# Altium schematic sheet 1_主体.schdoc
size 429 x 307 mm; Symbol: Drawing-Symbol_A4; Device: Drawing-Symbol_A4; Company: 嘉立创EDA; Version: V1.0; Page Size: A4; @Project Name: stm32f4; @Page Count: 3; @Update Date: 2025-11-05; @Create Date: 2025-11-05; @Schematic Name: Schematic1; @Page No: 1; @Page Name: 主体; @Create Time: 08:26:21; @Update Time: 16:26:23; Width: 1655; Height: 1170; Region Start: 1; X Region Count: 6; Y Region Count: 4; Blade Width: 10; Title Block Position: 3; @Board Name: Board1
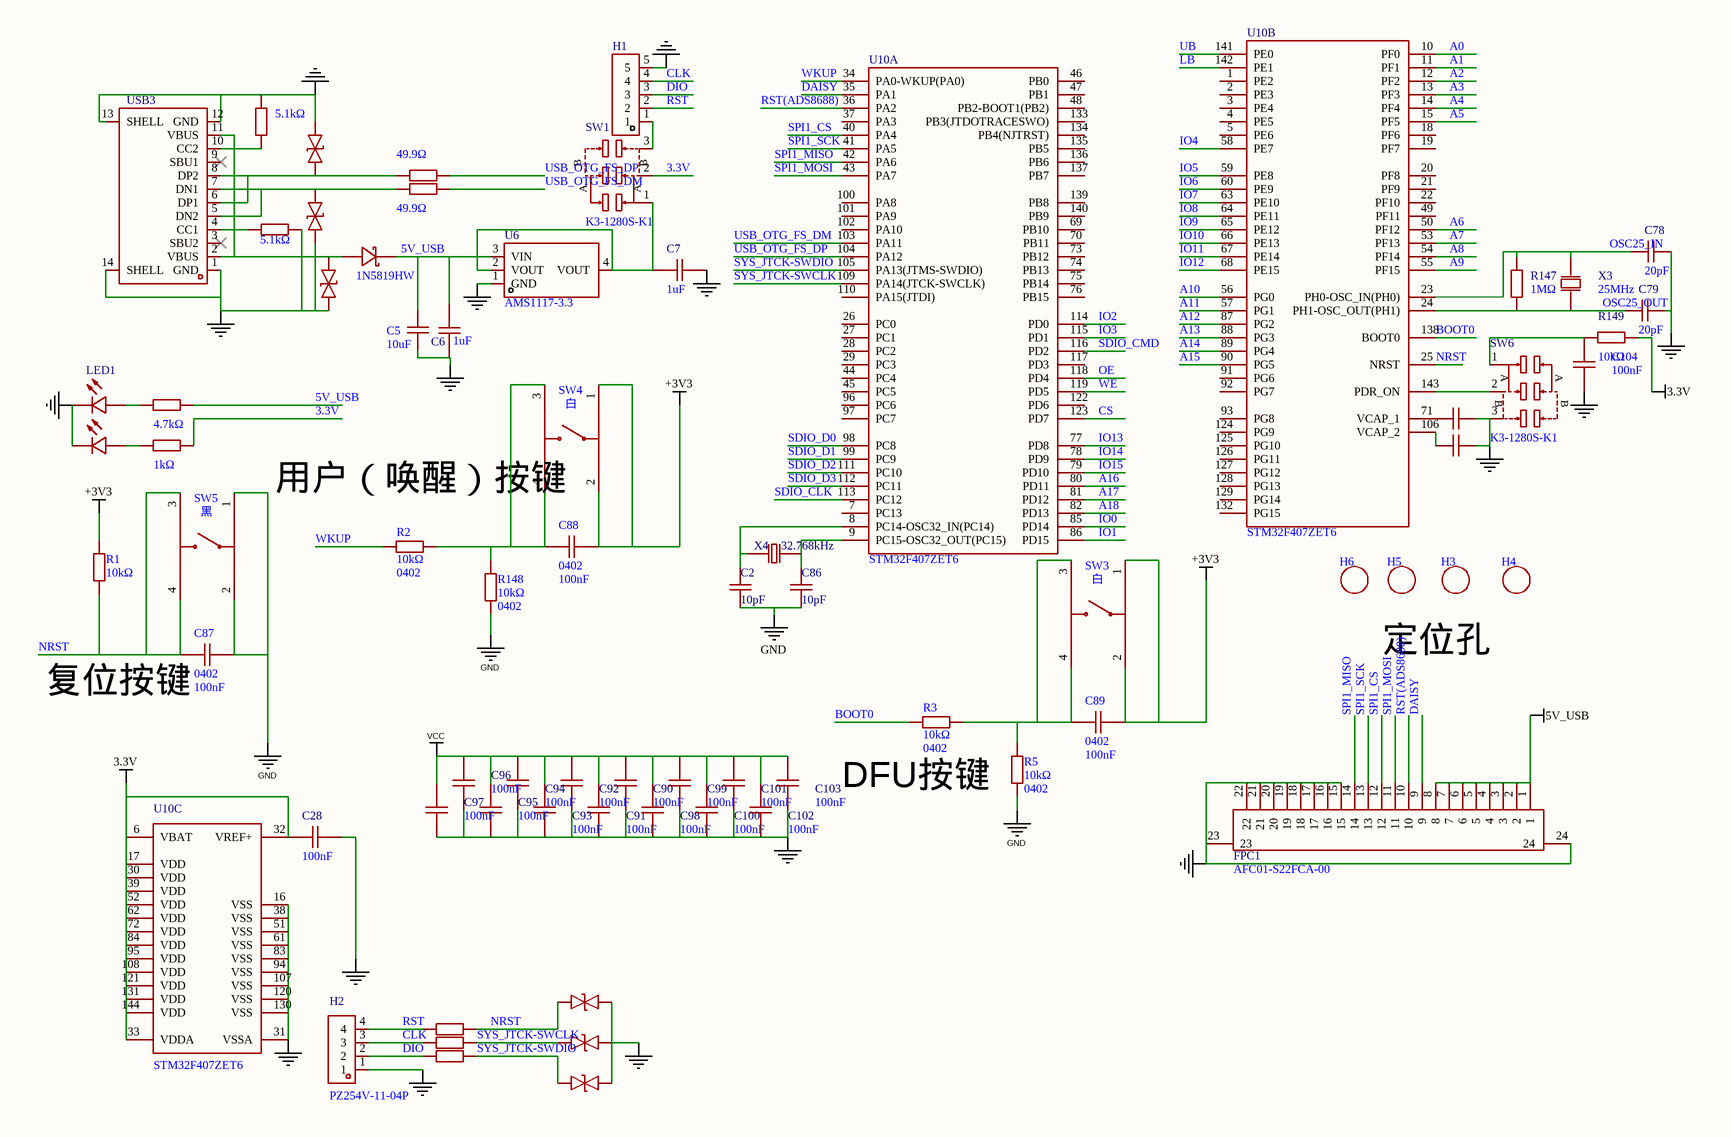
[diagram p0: 1_主体.schdoc]

## Parts
C2  value 10pF  [r0402]
C5  10uF  [C0603]
C6  1uF  [C0603]
C7  1uF  [C0603]
C28  100nF  [C0603]
C78  20pF  [C0603]
C79  20pF  [C0603]
C80  2.2uF  [C0603]  (value not drawn)
C81  2.2uF  [C0603]  (value not drawn)
C86  value 10pF  [r0402]
C87  Supplier Footprint: 0402  [C0402]  (hidden comment: 100nF)
C88  Supplier Footprint: 0402  [C0402]  (hidden comment: 100nF)
C89  Supplier Footprint: 0402  [C0402]  (hidden comment: 100nF)
C90  100nF  [C0402]
C91  100nF  [C0402]
C92  100nF  [C0402]
C93  100nF  [C0402]
C94  100nF  [C0402]
C95  100nF  [C0402]
C96  100nF  [C0402]
C97  100nF  [C0402]
C98  100nF  [C0402]
C99  100nF  [C0402]
C100  100nF  [C0402]
C101  100nF  [C0402]
C102  100nF  [C0402]
C103  100nF  [C0402]
C104  100nF  [C0402]
D9  0603ESDA-05N  [D0603-BI]  (value not drawn)
D10  0603ESDA-05N  [D0603-BI]  (value not drawn)
D11  0603ESDA-05N  [D0603-BI]  (value not drawn)
D13  LESD5D5.0CT1G  [SOD-523_L1.2-W0.8-LS1.6-BI]  (value not drawn)
D14  LESD5D5.0CT1G  [SOD-523_L1.2-W0.8-LS1.6-BI]  (value not drawn)
D15  LESD5D5.0CT1G  [SOD-523_L1.2-W0.8-LS1.6-BI]  (value not drawn)
D16  1N5819HW  [SOD-123_L2.7-W1.6-LS3.7-RD-1]
FPC1  AFC01-S22FCA-00  [FPC-SMD_P0.5-22P_FGS-XJ-H2.0]
H1  PZ254V-11-05P  [HDR-TH_5P-P2.54-V-M]  (value not drawn)
H2  PZ254V-11-04P  [HDR-TH_4P-P2.54-V-M]
H3  M3  [m3 125x300]  (value not drawn)
H4  M3  [m3 125x300]  (value not drawn)
H5  M3  [m3 125x300]  (value not drawn)
H6  M3  [m3 125x300]  (value not drawn)
LED1  19-217/R6C-AL1M2VY/3T  [LED0603-RD]  (value not drawn)
LED5  19-213/Y2C-CQ2R2L/3T(CY)  [LED0603-RD-YELLOW]  (value not drawn)
R1  10kΩ  [R0402]
R2  Supplier Footprint: 0402  [R0402]  (hidden comment: 10kΩ)
R3  Supplier Footprint: 0402  [R0402]  (hidden comment: 10kΩ)
R5  Supplier Footprint: 0402  [R0402]  (hidden comment: 10kΩ)
R7  49.9Ω  [R0603]  (value not drawn)
R8  49.9Ω  [R0603]  (value not drawn)
R9  49.9Ω  [R0603]  (value not drawn)
R21  49.9Ω  [R0603]
R22  49.9Ω  [R0603]
R24  5.1kΩ  [R0402]
R25  5.1kΩ  [R0402]
R26  4.7kΩ  [R0402]
R27  1kΩ  [R0402]
R147  1MΩ  [R0603]
R148  Supplier Footprint: 0402  [R0402]  (hidden comment: 10kΩ)
R149  10kΩ  [R0402]
SW1  K3-1280S-K1  [SW-SMD_K3-1280S-K1]
SW3  键帽颜色: 白  [SW-SMD_4P-L4.2-W3.4-P2.15-LS5.2]  (hidden comment: TSA017A2540A07)
SW4  键帽颜色: 白  [SW-SMD_4P-L4.2-W3.4-P2.15-LS5.2]  (hidden comment: TSA017A2540A07)
SW5  键帽颜色: 黑  [SW-SMD_4P-L4.2-W3.4-P2.15-LS5.2]  (hidden comment: TSA017A2540A03)
SW6  K3-1280S-K1  [SW-SMD_K3-1280S-K1]
U6  AMS1117-3.3  [SOT-223-3_L6.5-W3.4-P2.30-LS7.0-BR]
U10  STM32F407ZET6  [LQFP-144_L20.0-W20.0-P0.50-LS22.0-BL]  (parts A,B,C of 3)
USB3  TYPE-C 16PIN 2MD(073)  [USB-C-SMD_TYPE-C-6PIN-2MD-073]  (value not drawn)
X3  25MHz  [OSC-SMD_L5.0-W3.2]
X4  value 32.768kHz  [crystal-smd_l3.2-w1.5-1]

## Nets
3.3V: C28.1 R27.2 R149.2 SW1.2 U10.6(VBAT) U10.17(VDD) U10.30(VDD) U10.32(VREF+) U10.33(VDDA) U10.39(VDD) U10.52(VDD) U10.62(VDD) U10.72(VDD) U10.84(VDD) U10.95(VDD) U10.108(VDD) U10.121(VDD) U10.131(VDD) U10.144(VDD)
5V_USB: C5.2 C6.2 D16.1(K) FPC1.1 FPC1.2 FPC1.3 FPC1.4 FPC1.5 FPC1.6 FPC1.7 FPC1.8 R26.2 U6.3(VIN)
+3V3: C88.1 C89.1 R1.1 SW3.1 SW3.2 SW4.1 SW4.2
GND: C2.1 C5.1 C6.1 C7.2 C28.2 C78.1 C79.1 C80.2 C81.2 C86.1 C87.1 C90.2 C91.2 C92.2 C93.2 C94.2 C95.2 C96.2 C97.2 C98.2 C99.2 C100.2 C101.2 C102.2 C103.2 C104.1 D9.2 D10.2 D11.2 D13.1 D14.1 D15.1 FPC1.15 FPC1.16 FPC1.17 FPC1.18 FPC1.19 FPC1.20 FPC1.21 FPC1.22 FPC1.23 FPC1.24 H1.5 H2.1 LED1.1(C) LED5.1(C) R5.2 R24.2 R25.2 R148.2 SW5.1 SW5.2 SW6.3 U6.1(GND) U10.16(VSS) U10.31(VSSA) U10.38(VSS) U10.51(VSS) U10.61(VSS) U10.83(VSS) U10.94(VSS) U10.107(VSS) U10.120(VSS) U10.130(VSS) USB3.1(GND) USB3.12(GND) USB3.13(SHELL) USB3.14(SHELL)
VCC: C90.1 C91.1 C92.1 C93.1 C94.1 C95.1 C96.1 C97.1 C98.1 C99.1 C100.1 C101.1 C102.1 C103.1
A0: U10.10(PF0)
A1: U10.11(PF1)
A2: U10.12(PF2)
A3: U10.13(PF3)
A4: U10.14(PF4)
A5: U10.15(PF5)
A6: U10.50(PF12)
A7: U10.53(PF13)
A8: U10.54(PF14)
A9: U10.55(PF15)
A10: U10.56(PG0)
A11: U10.57(PG1)
A12: U10.87(PG2)
A13: U10.88(PG3)
A14: U10.89(PG4)
A15: U10.90(PG5)
A16: U10.80(PD11)
A17: U10.81(PD12)
A18: U10.82(PD13)
BOOT0: R3.1 U10.138(BOOT0)
CLK: H1.4 H2.3 R8.1
CS: U10.123(PD7)
DAISY: FPC1.9 U10.35(PA1)
DIO: H1.3 H2.2 R9.1
IO0: U10.85(PD14)
IO1: U10.86(PD15)
IO2: U10.114(PD0)
IO3: U10.115(PD1)
IO4: U10.58(PE7)
IO5: U10.59(PE8)
IO6: U10.60(PE9)
IO7: U10.63(PE10)
IO8: U10.64(PE11)
IO9: U10.65(PE12)
IO10: U10.66(PE13)
IO11: U10.67(PE14)
IO12: U10.68(PE15)
IO13: U10.77(PD8)
IO14: U10.78(PD9)
IO15: U10.79(PD10)
LB: U10.142(PE1)
NRST: C87.2 D9.1 R1.2 R7.2 SW5.3 SW5.4 U10.25(NRST)
OE: U10.118(PD4)
OSC25_IN: C78.2 R147.2 U10.23(PH0-OSC_IN(PH0)) X3.2(OSC2)
OSC25_OUT: C79.2 R147.1 U10.24(PH1-OSC_OUT(PH1)) X3.1(OSC1)
RST: H1.2 H2.4 R7.1
RST(ADS8688): FPC1.10 U10.36(PA2)
SDIO_CLK: U10.113(PC12)
SDIO_CMD: U10.116(PD2)
SDIO_D0: U10.98(PC8)
SDIO_D1: U10.99(PC9)
SDIO_D2: U10.111(PC10)
SDIO_D3: U10.112(PC11)
SPI1_CS: FPC1.12 U10.40(PA4)
SPI1_MISO: FPC1.14 U10.42(PA6)
SPI1_MOSI: FPC1.11 U10.43(PA7)
SPI1_SCK: FPC1.13 U10.41(PA5)
SYS_JTCK-SWCLK: D10.1 R8.2 U10.109(PA14(JTCK-SWCLK))
SYS_JTCK-SWDIO: D11.1 R9.2 U10.105(PA13(JTMS-SWDIO))
UB: U10.141(PE0)
USB_OTG_FS_DM: R22.1 U10.103(PA11)
USB_OTG_FS_DP: R21.1 U10.104(PA12)
WE: U10.119(PD5)
WKUP: R2.1 U10.34(PA0-WKUP(PA0))
NetC2_2: C2.2 U10.8(PC14-OSC32_IN(PC14)) X4.1
NetC7_1: C7.1 SW1.1 U6.2(VOUT) U6.4(VOUT)
NetC80_1: C80.1 U10.71(VCAP_1)
NetC81_1: C81.1 U10.106(VCAP_2)
NetC86_2: C86.2 U10.9(PC15-OSC32_OUT(PC15)) X4.2
NetC88_2: C88.2 R2.2 R148.1 SW4.3 SW4.4
NetC89_2: C89.2 R3.2 R5.1 SW3.3 SW3.4
NetC104_2: C104.2 R149.1 SW6.1
NetD13_2: D13.2 R21.2 USB3.6(DP1) USB3.8(DP2)
NetD14_2: D14.2 R22.2 USB3.5(DN2) USB3.7(DN1)
NetD15_2: D15.2 D16.2(A) USB3.2(VBUS) USB3.11(VBUS)
NetH1_1: H1.1 SW1.3
NetLED1_2: LED1.2(A) R26.1
NetLED5_2: LED5.2(A) R27.1
NetR24_1: R24.1 USB3.10(CC2)
NetR25_1: R25.1 USB3.4(CC1)
NetSW6_2: SW6.2 U10.143(PDR_ON)

Not connected (* = marked no-connect by the designer): U10 1(PE2) 2(PE3) 3(PE4) 4(PE5) 5(PE6) 7(PC13) 18(PF6) 19(PF7) 20(PF8) 21(PF9) 22(PF10) 26(PC0) 27(PC1) 28(PC2) 29(PC3) 37(PA3) 44(PC4) 45(PC5) 46(PB0) 47(PB1) 48(PB2-BOOT1(PB2)) 49(PF11) 69(PB10) 70(PB11) 73(PB12) 74(PB13) 75(PB14) 76(PB15) 91(PG6) 92(PG7) 93(PG8) 96(PC6) 97(PC7) 100(PA8) 101(PA9) 102(PA10) 110(PA15(JTDI)) 117(PD3) 122(PD6) 124(PG9) 125(PG10) 126(PG11) 127(PG12) 128(PG13) 129(PG14) 132(PG15) 133(PB3(JTDOTRACESWO)) 134(PB4(NJTRST)) 135(PB5) 136(PB6) 137(PB7) 139(PB8) 140(PB9); USB3 3(SBU2)* 9(SBU1)*

## Notes on the sheet
- 用户（唤醒）按键
- 复位按键
- 定位孔
- DFU按键
- 1
- 2
- 3
- 4
- 5
- 6
- A
- B
- C
- 原理图
- Schematic1
- 创建日期
- 更新日期
- 2025-11-05
- D
- 板子
- 绘制
- Board1
- 图页
- 主体
- 审阅
- 版本
- 尺寸
- stm32f4
- 页    1    共    3
- V1.0
- A4
- 嘉立创EDA
- (in symbol K3-1280S-K1) B; A

## Library data of the parts
C2 C86 = CC0402JRNPO9BN100: Manufacturer: YAGEO(国巨); Add into BOM: yes; Tolerance: ±5%; Voltage Rated: 50V; Temperature Coefficient: NP0; Symbol: cc0402jrnpo9bn100; Device: CC0402JRNPO9BN100; LCSC Part Name: 10pF ±5% 50V; Supplier Part: C106199; Manufacturer Part: CC0402JRNPO9BN100; Supplier Footprint: 0402; JLCPCB Part Class: Extended Part; Datasheet: https://atta.szlcsc.com/upload/public/pdf/source/20170518/1495085708228.pdf; Supplier: LCSC; Convert to PCB: yes
C5 = 0603X106K100NT: Manufacturer: FH(风华); Add into BOM: yes; Tolerance: ±10%; Voltage Rated: 10V; Temperature Coefficient: X5R; Symbol: 0603X106K100NT; Device: 0603X106K100NT; LCSC Part Name: 10uF ±10% 10V; Supplier Part: C38898; Manufacturer Part: 0603X106K100NT; Supplier Footprint: 0603; Datasheet: https://atta.szlcsc.com/upload/public/pdf/source/20170923/C38898_1506149449306988751.pdf; Supplier: LCSC; Convert to PCB: yes; Value: 10uF
C6 C7 = CL10A105KB8NNNC: Manufacturer: SAMSUNG(三星); Add into BOM: yes; Tolerance: ±10%; Voltage Rating: 50V; Temperature Coefficient: X5R; Symbol: CL10A105KB8NNNC; Device: CL10A105KB8NNNC; LCSC Part Name: 1uF ±10% 50V; Supplier Part: C15849; Manufacturer Part: CL10A105KB8NNNC; Supplier Footprint: 0603; JLCPCB Part Class: 基础库; Datasheet: https://item.szlcsc.com/datasheet/CL10A105KB8NNNC/16531.html; Supplier: LCSC; Convert to PCB: yes; Value: 1uF
C28 = CC0603KRX7R9BB104: Manufacturer: YAGEO(国巨); Add into BOM: yes; Tolerance: ±10%; Voltage Rated: 50V; Temperature Coefficient: X7R; Symbol: CC0603KRX7R9BB104; Device: CC0603KRX7R9BB104; LCSC Part Name: 100nF ±10% 50V; Supplier Part: C14663; Manufacturer Part: CC0603KRX7R9BB104; Supplier Footprint: 0603; JLCPCB Part Class: 基础库; Datasheet: https://atta.szlcsc.com/upload/public/pdf/source/20180910/C282072_33301C7F631E79921B82A8DAC6BCC5B3.pdf; Supplier: LCSC; Convert to PCB: yes; Value: 100nF; Voltage Rating: 50V
C78 C79 = CL10C200JB8NNNC: Manufacturer: SAMSUNG(三星); Add into BOM: yes; Tolerance: ±5%; Voltage Rating: 50V; Temperature Coefficient: C0G; Symbol: CL10C200JB8NNNC; Device: CL10C200JB8NNNC; LCSC Part Name: 20pF ±5% 50V; Supplier Part: C1648; Manufacturer Part: CL10C200JB8NNNC; Supplier Footprint: 0603; JLCPCB Part Class: 基础库; Datasheet: https://item.szlcsc.com/datasheet/CL10C200JB8NNNC/2000.html; Supplier: LCSC; Convert to PCB: yes; Value: 20pF
C80 C81 = CL10A225KO8NNNC: Manufacturer: SAMSUNG(三星); Add into BOM: yes; Tolerance: ±10%; Voltage Rating: 16V; Temperature Coefficient: X5R; Symbol: CL10A225KO8NNNC; Device: CL10A225KO8NNNC; LCSC Part Name: 2.2uF ±10% 16V; Supplier Part: C23630; Manufacturer Part: CL10A225KO8NNNC; Supplier Footprint: 0603; JLCPCB Part Class: 基础库; Datasheet: https://item.szlcsc.com/datasheet/CL10A225KO8NNNC/24366.html; Supplier: LCSC; Convert to PCB: yes; Value: 2.2uF
C87-C89 C104 = CC0402KRX7R7BB104: Manufacturer: YAGEO(国巨); Add into BOM: yes; Tolerance: ±10%; Voltage Rated: 16V; Temperature Coefficient: X7R; Symbol: CC0402KRX7R7BB104; Device: CC0402KRX7R7BB104; LCSC Part Name: 100nF ±10% 16V; Supplier Part: C60474; Manufacturer Part: CC0402KRX7R7BB104; Datasheet: https://atta.szlcsc.com/upload/public/pdf/source/20211223/9278FD768280B81DDBEF48FA36411A03.pdf; Supplier: LCSC; Convert to PCB: yes; Value: 100nF
  C104: Supplier Footprint: 0402
C90-C103 = CL05B104KB54PNC: Manufacturer: SAMSUNG(三星); Add into BOM: yes; Tolerance: ±10%; Voltage Rating: 50V; Temperature Coefficient: X7R; Symbol: CL05B104KB54PNC; Device: CL05B104KB54PNC; LCSC Part Name: 100nF ±10% 50V; Supplier Part: C307331; Manufacturer Part: CL05B104KB54PNC; Supplier Footprint: 0402; JLCPCB Part Class: 基础库; Datasheet: https://item.szlcsc.com/datasheet/CL05B104KB54PNC/291005.html; Supplier: LCSC; Convert to PCB: yes; Value: 100nF
D9-D11 = 0603ESDA-05N: Manufacturer: BORN(伯恩半导体); Add into BOM: yes; Polarity: 双向; Reverse Stand-Off Voltage (Vrwm): 5V; Clamping Voltage: 50V; Reverse Leakage Current (Ir): 500nA; level of protection: IEC 61000-4-2; Type: ESD; Junction Capacitance: 1.5pF; Symbol: 0603ESDA-05N; Device: 0603ESDA-05N; LCSC Part Name: 双向ESD 5V截止; Supplier Part: C316054; Manufacturer Part: 0603ESDA-05N; Supplier Footprint: 0603; JLCPCB Part Class: 扩展库; Datasheet: https://item.szlcsc.com/datasheet/0603ESDA-05N/297742.html; Supplier: LCSC; Convert to PCB: yes
D13-D15 = LESD5D5.0CT1G: Manufacturer: LRC(乐山无线电); Add into BOM: yes; Polarity: 双向; Reverse Stand-Off Voltage (Vrwm): 5V; Clamping Voltage: 18.6V; Peak Pulse Current (Ipp): 9.4A@8/20us; Peak Pulse Power Dissipation (Ppp): 150W@8/20us; Voltage - Breakdown: 7.8V; Reverse Leakage Current (Ir): 1uA; level of protection: IEC 61000-4-4；IEC 61000-4-2; Type: ESD; Junction Capacitance: 15pF; Symbol: LESD5D5.0CT1G; Device: LESD5D5.0CT1G; LCSC Part Name: 双向ESD 5V截止 峰值脉冲电流：9.4A@8/20us; Supplier Part: C383211; Manufacturer Part: LESD5D5.0CT1G; Supplier Footprint: SOD-523; JLCPCB Part Class: 扩展库; Datasheet: https://item.szlcsc.com/datasheet/LESD5D5.0CT1G/356518.html; Supplier: LCSC; Convert to PCB: yes; Operating Temperature: -40℃~+125℃
D16 = 1N5819HW: Manufacturer: TECH PUBLIC(台舟); Add into BOM: yes; Voltage - Forward(Vf@If): 900mV@3A; Voltage - DC Reverse(Vr): 40V; Current - Rectified: 1A; Reverse Leakage Current (Ir): 1mA@40V; Non-Repetitive Peak Forward Surge Current: 9A; Symbol: 1N5819HW; Device: 1N5819HW; LCSC Part Name: 电压:40V 电流:1A; Supplier Part: C2905649; Manufacturer Part: 1N5819HW; Supplier Footprint: SOD-123; JLCPCB Part Class: 扩展库; Datasheet: https://item.szlcsc.com/datasheet/1N5819HW/3175946.html; Supplier: LCSC; Convert to PCB: yes; Diode Configuration: -
FPC1 = AFC01-S22FCA-00: Manufacturer: JS(钜硕电子); Add into BOM: yes; Locking Feature: 翻盖式; Number of Contacts: 22P; Pitch: 0.5mm; FFC, FCB Thickness: 0.3mm; Symbol: AFC01-S22FCA-00; Device: AFC01-S22FCA-00; LCSC Part Name: 间距:0.5mm P数:22P 翻盖式 下接; Supplier Part: C262668; Manufacturer Part: AFC01-S22FCA-00; Supplier Footprint: SMD,P=0.5mm,卧贴; JLCPCB Part Class: 扩展库; Datasheet: https://atta.szlcsc.com/upload/public/pdf/source/20190816/C413942_2A72D1AC756EAE17EEDF756A339D4500.pdf; Supplier: LCSC; Convert to PCB: yes; Contact Type: 下接; Mounting Type: 卧贴; Height Above Board: 2mm
H1 = PZ254V-11-05P: Manufacturer: XFCN(兴飞); Add into BOM: yes; Pin Structure: 1x5P; Pitch: 2.54mm; Circluar Pins/Square Pins: 方针; Symbol: PZ254V-11-05P; Device: PZ254V-11-05P; LCSC Part Name: 1x5P 间距:2.54mm 方针 直插; Supplier Part: C492404; Manufacturer Part: PZ254V-11-05P; Supplier Footprint: 插件,P=2.54mm; JLCPCB Part Class: 扩展库; Datasheet: https://atta.szlcsc.com/upload/public/pdf/source/20200309/C492404_E51533260F8710EFF5D4617281164C1D.pdf; Supplier: LCSC; Convert to PCB: yes; Row Spacing: -; Mounting Type: 直插; Number of Rows: 单排; Number of Pins: 5P; Current Rating: -; Voltage Rating (Max): -; Length of Mating Pin: 6mm; Insulation Height: 2.5mm; Length of End Connection Pin: 3mm; Contact Material: 黄铜; Contact Plating: -; Operating Temperature: -40℃~+105℃; Color: 黑色
H2 = PZ254V-11-04P: Manufacturer: XFCN(兴飞); Symbol: PZ254V-11-04P_C2691448; Add into BOM: yes; Pin Structure: 1x4P; Pitch: 2.54mm; Circluar Pins/Square Pins: 方针; Current Rating: 3A; Voltage Rating (Max): 250V; Device: PZ254V-11-04P; LCSC Part Name: 1x4P 间距:2.54mm 方针 直插; Supplier Part: C2691448; Manufacturer Part: PZ254V-11-04P; Supplier Footprint: 插件,P=2.54mm; JLCPCB Part Class: 扩展库; Datasheet: https://item.szlcsc.com/datasheet/PZ254V-11-04P/2801085.html; Supplier: LCSC; Convert to PCB: yes; Row Spacing: -; Mounting Type: 直插; Number of Rows: 单排; Number of Pins: 4P; Length of Mating Pin: 6mm; Insulation Height: 2.5mm; Length of End Connection Pin: 3mm; Contact Material: -; Operating Temperature: -40℃~+105℃; Color: 黑色
H3-H6 = m3_3: Add into BOM: yes; Symbol: m3; Device: m3_3; Convert to PCB: yes
LED1 = 19-217/R6C-AL1M2VY/3T: Manufacturer: EVERLIGHT(亿光); Add into BOM: yes; Illumination Color: 红色; Voltage - Forward(Vf): 1.95V; Power(Watts): 60mW; Forward Current: 5mA; Wavelength - Dominant: 617.5nm; Peak Wavelength: 632nm; Lens Color: 无色透明透镜; Viewing Angle: 120°; Symbol: 19-217/R6C-AL1M2VY/3T; Device: 19-217/R6C-AL1M2VY/3T; LCSC Part Name: 红灯 停产; Supplier Part: C72044; Manufacturer Part: 19-217/R6C-AL1M2VY/3T; Supplier Footprint: 0603; JLCPCB Part Class: 扩展库; Supplier: LCSC; Convert to PCB: yes; Diode Configuration: -; Color Temperature: -; Mounting Style: -; Operating Temperature: -40℃~+85℃
LED5 = 19-213/Y2C-CQ2R2L/3T(CY): Manufacturer: EVERLIGHT(亿光); Add into BOM: yes; Emitted Color: 黄灯; Lens Color: 无色透明; Dominant Wavelength: 585.5nm~591.5nm; Peak Wavelength: 591nm; Forward Current: 20mA; Power Dissipation: 60mW; Viewing Angle: 120°; Symbol: 19-213/Y2C-CQ2R2L/3T(CY); Device: 19-213/Y2C-CQ2R2L/3T(CY); LCSC Part Name: 黄灯; Supplier Part: C72038; Manufacturer Part: 19-213/Y2C-CQ2R2L/3T(CY); Supplier Footprint: 0603; JLCPCB Part Class: 基础库; Datasheet: https://atta.szlcsc.com/upload/public/pdf/source/20160507/1462613613586.pdf; Supplier: LCSC; Convert to PCB: yes; Diode Configuration: -; Color Temperature: -; Mounting Sytle: -; Operating Temperature: -40℃~+85℃
R1-R3 R5 R148 = RC0402FR-0710KL: Manufacturer: YAGEO(国巨); Add into BOM: yes; Tolerance: ±1%; Power(Watts): 62.5mW; Temperature Coefficient: ±100ppm/℃; Overload Voltage (Max): 50V; Symbol: RC0402FR-0710KL; Device: RC0402FR-0710KL; LCSC Part Name: 10kΩ ±1% 62.5mW; Supplier Part: C60490; Manufacturer Part: RC0402FR-0710KL; JLCPCB Part Class: 扩展库; Datasheet: https://atta.szlcsc.com/upload/public/pdf/source/20170606/1496716515432.pdf; Supplier: LCSC; Convert to PCB: yes; Type: 厚膜电阻; Value: 10kΩ; Operating Temperature Range: -55℃~+155℃
  R1: Supplier Footprint: 0402
R7-R9 R21 R22 = 0603WAF499JT5E: Manufacturer: UNI-ROYAL(厚声); Add into BOM: yes; Tolerance: ±1%; Power(Watts): 100mW; Voltage-Supply(Max): 75V; Temperature Coefficient: ±100ppm/℃; Symbol: 0603WAF499JT5E; Device: 0603WAF499JT5E; LCSC Part Name: 49.9Ω ±1% 100mW 厚膜电阻; Supplier Part: C23185; Manufacturer Part: 0603WAF499JT5E; Supplier Footprint: 0603; JLCPCB Part Class: 基础库; Datasheet: https://item.szlcsc.com/datasheet/0603WAF499JT5E/23912.html; Supplier: LCSC; Convert to PCB: yes; Type: 厚膜电阻; Value: 49.9Ω; Operating Temperature: -55℃~+155℃
R24 R25 = 0402WGF5101TCE: Manufacturer: UNI-ROYAL(厚声); Add into BOM: yes; Tolerance: ±1%; Power(Watts): 62.5mW; Voltage-Supply(Max): 50V; Temperature Coefficient: ±100ppm/℃; Symbol: 0402WGF5101TCE; Device: 0402WGF5101TCE; LCSC Part Name: 5.1kΩ ±1% 62.5mW 厚膜电阻; Supplier Part: C25905; Manufacturer Part: 0402WGF5101TCE; Supplier Footprint: 0402; JLCPCB Part Class: 基础库; Datasheet: https://item.szlcsc.com/datasheet/0402WGF5101TCE/26648.html; Supplier: LCSC; Convert to PCB: yes; Type: 厚膜电阻; Value: 5.1kΩ; Operating Temperature: -55℃~+155℃
R26 = 0402WGF4701TCE: Manufacturer: UNI-ROYAL(厚声); Add into BOM: yes; Tolerance: ±1%; Power(Watts): 62.5mW; Voltage-Supply(Max): 50V; Temperature Coefficient: ±100ppm/℃; Symbol: 0402WGF4701TCE; Device: 0402WGF4701TCE; LCSC Part Name: 4.7kΩ ±1% 62.5mW 厚膜电阻; Supplier Part: C25900; Manufacturer Part: 0402WGF4701TCE; Supplier Footprint: 0402; JLCPCB Part Class: 基础库; Datasheet: https://item.szlcsc.com/datasheet/0402WGF4701TCE/26643.html; Supplier: LCSC; Convert to PCB: yes; Type: 厚膜电阻; Value: 4.7kΩ; Operating Temperature: -55℃~+155℃
R27 = 0402WGF1001TCE: Manufacturer: UNI-ROYAL(厚声); Add into BOM: yes; Tolerance: ±1%; Power(Watts): 62.5mW; Voltage-Supply(Max): 50V; Temperature Coefficient: ±100ppm/℃; Symbol: 0402WGF1001TCE; Device: 0402WGF1001TCE; LCSC Part Name: 1kΩ ±1% 62.5mW 厚膜电阻; Supplier Part: C11702; Manufacturer Part: 0402WGF1001TCE; Supplier Footprint: 0402; JLCPCB Part Class: 基础库; Datasheet: https://item.szlcsc.com/datasheet/0402WGF1001TCE/12256.html; Supplier: LCSC; Convert to PCB: yes; Type: 厚膜电阻; Value: 1kΩ; Operating Temperature: -55℃~+155℃
R147 = 0603WAF1004T5E: Manufacturer: UNI-ROYAL(厚声); Add into BOM: yes; Tolerance: ±1%; Power(Watts): 100mW; Overload Voltage (Max): 75V; Temperature Coefficient: ±100ppm/℃; Symbol: 0603WAF1004T5E; Device: 0603WAF1004T5E; LCSC Part Name: 1MΩ ±1% 100mW 厚膜电阻; Supplier Part: C22935; Manufacturer Part: 0603WAF1004T5E; Supplier Footprint: 0603; JLCPCB Part Class: 基础库; Datasheet: https://atta.szlcsc.com/upload/public/pdf/source/20200306/C422600_1E6D84923E4A46A82E41ADD87F860B5C.pdf; Supplier: LCSC; Convert to PCB: yes; Type: 厚膜电阻; Value: 1MΩ; Operating Temperature Range: -55℃~+155℃
R149 = 0402WGF1002TCE: Manufacturer: UNI-ROYAL(厚声); Add into BOM: yes; Tolerance: ±1%; Power(Watts): 62.5mW; Voltage-Supply(Max): 50V; Temperature Coefficient: ±100ppm/℃; Symbol: 0402WGF1002TCE; Device: 0402WGF1002TCE; LCSC Part Name: 10kΩ ±1% 62.5mW 厚膜电阻; Supplier Part: C25744; Manufacturer Part: 0402WGF1002TCE; Supplier Footprint: 0402; JLCPCB Part Class: 基础库; Datasheet: https://item.szlcsc.com/datasheet/0402WGF1002TCE/26487.html; Supplier: LCSC; Convert to PCB: yes; Type: 厚膜电阻; Value: 10kΩ; Operating Temperature: -55℃~+155℃
SW1 SW6 = K3-1280S-K1: Manufacturer: 韩国韩荣; Add into BOM: yes; Circuit: 单刀双掷; Actuator Style: 矩形柱状; Switch Height: 3.5mm; Actuator Color: 黑色; Current Rating: 300mA; Voltage Rating: 6V; Life: 1万次; Symbol: K3-1280S-K1; Device: K3-1280S-K1; LCSC Part Name: 卧贴双档 滑动开关; Supplier Part: C128953; Manufacturer Part: K3-1280S-K1; Supplier Footprint: SMD,9.1x3.7mm; JLCPCB Part Class: 扩展库; Datasheet: https://item.szlcsc.com/datasheet/K3-1280S-K1/140239.html; Supplier: LCSC; Convert to PCB: yes; Termination Style: 鸥翼型; Length: 9.1mm; Width: 3.7mm; Mounting Type: 卧贴; Operating Temperature: -25℃~+80℃
SW3 SW4 = TSA017A2540A07: Manufacturer: BZCN(博众电气); Add into BOM: yes; Contact Current: 50mA; Voltage Rating (DC): 12V; Actuator Style: 椭圆形按钮; Switch Length: 4.2mm; Switch Width: 3.35mm; Switch Height: 2.5mm; Symbol: TSA017A2540A07; Device: TSA017A2540A07; LCSC Part Name: 4.2*3.35*2.5mm 立贴 轻触开关; Supplier Part: C2888434; Manufacturer Part: TSA017A2540A07; Supplier Footprint: SMD; JLCPCB Part Class: 扩展库; Datasheet: https://atta.szlcsc.com/upload/public/pdf/source/20210906/F29F74F1A6DE5E6C38338EAD973C3529.pdf; Supplier: LCSC; Convert to PCB: yes; Voltage Rating (AC): -; Mounting Style: 立贴; Mechanical Life: -
SW5 = TSA017A2540A03: Manufacturer: BZCN(博众电气); Add into BOM: yes; Contact Current: 50mA; Voltage Rating (DC): 12V; Actuator Style: 椭圆形按钮; Switch Length: 4.2mm; Switch Width: 3.35mm; Switch Height: 2.5mm; Symbol: TSA017A2540A03; Device: TSA017A2540A03; LCSC Part Name: 4.2*3.35*2.5mm 立贴 轻触开关; Supplier Part: C2888435; Manufacturer Part: TSA017A2540A03; Supplier Footprint: SMD; JLCPCB Part Class: 扩展库; Datasheet: https://atta.szlcsc.com/upload/public/pdf/source/20210906/F29F74F1A6DE5E6C38338EAD973C3529.pdf; Supplier: LCSC; Convert to PCB: yes; Voltage Rating (AC): -; Mounting Style: 立贴; Mechanical Life: -
U6 = AMS1117-3.3_C6186: Manufacturer: AMS; Add into BOM: yes; Output Type: 固定; Voltage - Supply: 16V; Output Voltage: 3.3V; Output Current: 1A; Power Supply Rejection Ratio (PSRR): 72dB@(120Hz); Voltage Dropout: 1.1V@(800mA); standby current: 5mA; Noise: 0.003%Vout; Output Configuration: 正极; Number of Outputs: 1; Symbol: AMS1117-3.3; Device: AMS1117-3.3_C6186; LCSC Part Name: 输出3.3V 1A; Supplier Part: C6186; Manufacturer Part: AMS1117-3.3; Supplier Footprint: SOT-223; JLCPCB Part Class: 基础库; Datasheet: https://item.szlcsc.com/datasheet/AMS1117-3.3/6652.html; Supplier: LCSC; Convert to PCB: yes; Features: 过流保护；过热保护; Operating Temperature: -40℃~+125℃
U10 = STM32F407ZET6: Manufacturer: ST(意法半导体); Add into BOM: yes; Core Size: 32-Bit; Program Memory Type: FLASH; Core Processor: ARM® Cortex®-M4; Speed: 168MHz; Voltage - Supply (Vcc/Vdd): 1.8V ~ 3.6V; Program Memory Size: 512KB; RAM Size: 192KB; Number of I/O: 114; A/D: 24x12bit; D/A: 2x12bit; PWM: 56; LCD: MOTOROLA 6800 AND INTEL  8080 TYPE LCD DIRECTLY; UART/USART: 4 USART+2 UART; SPI: 3; USB Device: 1; CAN: 2; Ethernet: 10/100 Ethernet MAC; Relevance: []; Symbol: STM32F407ZET6; Device: STM32F407ZET6; LCSC Part Name: STM32F407ZET6; Supplier Part: C36869; Manufacturer Part: STM32F407ZET6; Supplier Footprint: LQFP-144_20x20x05P; JLCPCB Part Class: Extended Part; Datasheet: https://atta.szlcsc.com/upload/public/pdf/source/20160816/1471342957598.pdf; Supplier: LCSC; Convert to PCB: yes; EEPROM Size: -; I2C（SMBUS/PMBUS）: 3; USB Host/OTG: 1; Features: I2S
USB3 = TYPE-C 16PIN 2MD(073): Manufacturer: SHOU HAN(首韩); Add into BOM: yes; Gender: 母; Number of Contacts: 16P; Number of Ports: 1; Current Rating-Power: 3A; Voltage Rating: 5V; Connect-Disconnect Life: 5千次; Detection color: 黑色; Symbol: TYPE-C 16PIN 2MD(073); Device: TYPE-C 16PIN 2MD(073); LCSC Part Name: Type-C 母 卧贴; Supplier Part: C2765186; Manufacturer Part: TYPE-C 16PIN 2MD(073); Supplier Footprint: SMD; JLCPCB Part Class: 扩展库; Datasheet: https://item.szlcsc.com/datasheet/TYPE-C%252016PIN%25202MD(073)/2901843.html; Supplier: LCSC; Convert to PCB: yes; Connector Type: Type-C; Protocol Standard: -; Mounting Type: 卧贴; Supplementary Features: -; Center Height: -; Length: -; Operating Temperature: -25℃~+85℃
X3 = X503225MSB2GI: Manufacturer: YXC(扬兴晶振); Add into BOM: yes; Normal temperature Frequency Tolerance: ±10ppm; Load Capacitance: 20pF; Frequency Stability: ±20ppm; Symbol: X503225MSB2GI; Device: X503225MSB2GI; LCSC Part Name: YSX530GA 25MHZ 2P 5032 20PF ±10PPM -40~85℃ (±20PPM); Supplier Part: C112569; Manufacturer Part: X503225MSB2GI; Supplier Footprint: SMD5032-2P; JLCPCB Part Class: 扩展库; Datasheet: https://item.szlcsc.com/datasheet/X503225MSB2GI/113802.html; Supplier: LCSC; Convert to PCB: yes; Type: 贴片晶振; Value: 25MHz; Operating Temperature: -40℃~+85℃
X4 = FC31M2-32.768-NTLLLDT: Manufacturer: HCI(杭晶); Add into BOM: yes; Crystal Type: 贴片无源晶振; Load Capacitance: 12.5pF; Frequency Tolerance: ±20ppm; Equivalent Series Resistance (ESR): 50kΩ; Symbol: FC31M2-32.768-NTLLLDT; Device: FC31M2-32.768-NTLLLDT; LCSC Part Name: 32.768kHz ±20ppm 12.5pF; Supplier Part: C2842180; Manufacturer Part: FC31M2-32.768-NTLLLDT; Supplier Footprint: SMD3215-2P; JLCPCB Part Class: Extended Part; Datasheet: https://atta.szlcsc.com/upload/public/pdf/source/20210629/C2842180_48F42A0423E39BF52E220D7A1E6B6693.pdf; Supplier: LCSC; Convert to PCB: yes; Operating Temperature: -40~+85; Frequency Stability: ±20ppm